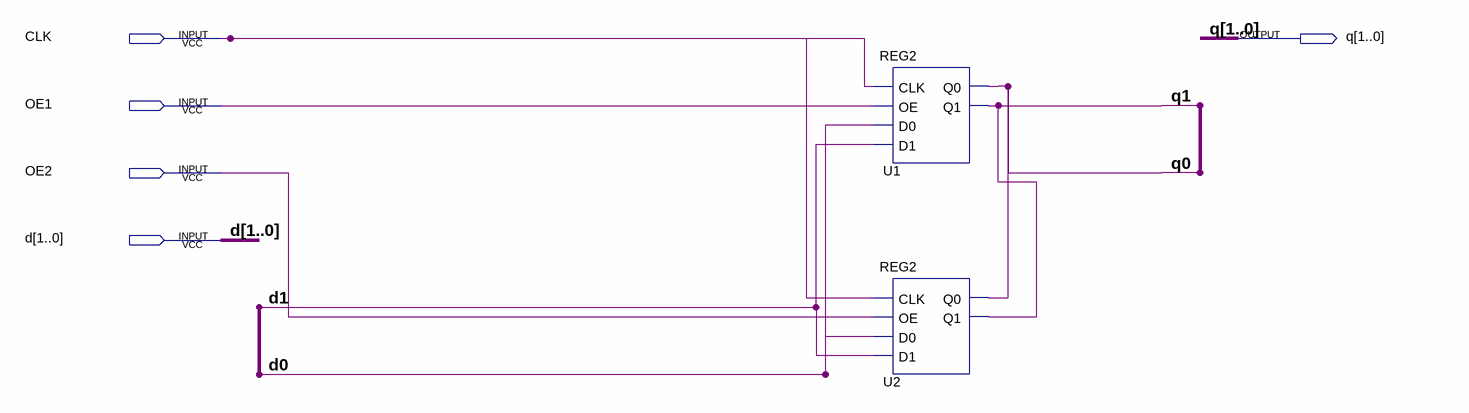
[diagram p0: schematic sheet]
// Quartus schematic BUS2.bdf as structural Verilog: 2 symbols, 5 pins
module BUS2 (
  input  CLK,
  input  OE1,
  input  OE2,
  input  [1:0] d,
  output [1:0] q
);

  REG2 U1 (.CLK(CLK), .OE(OE1), .D0(d[0]), .D1(d[1]), .Q0(q[0]), .Q1(q[1]));
  REG2 U2 (.CLK(CLK), .OE(OE2), .D0(d[0]), .D1(d[1]), .Q0(q[0]), .Q1(q[1]));
endmodule
